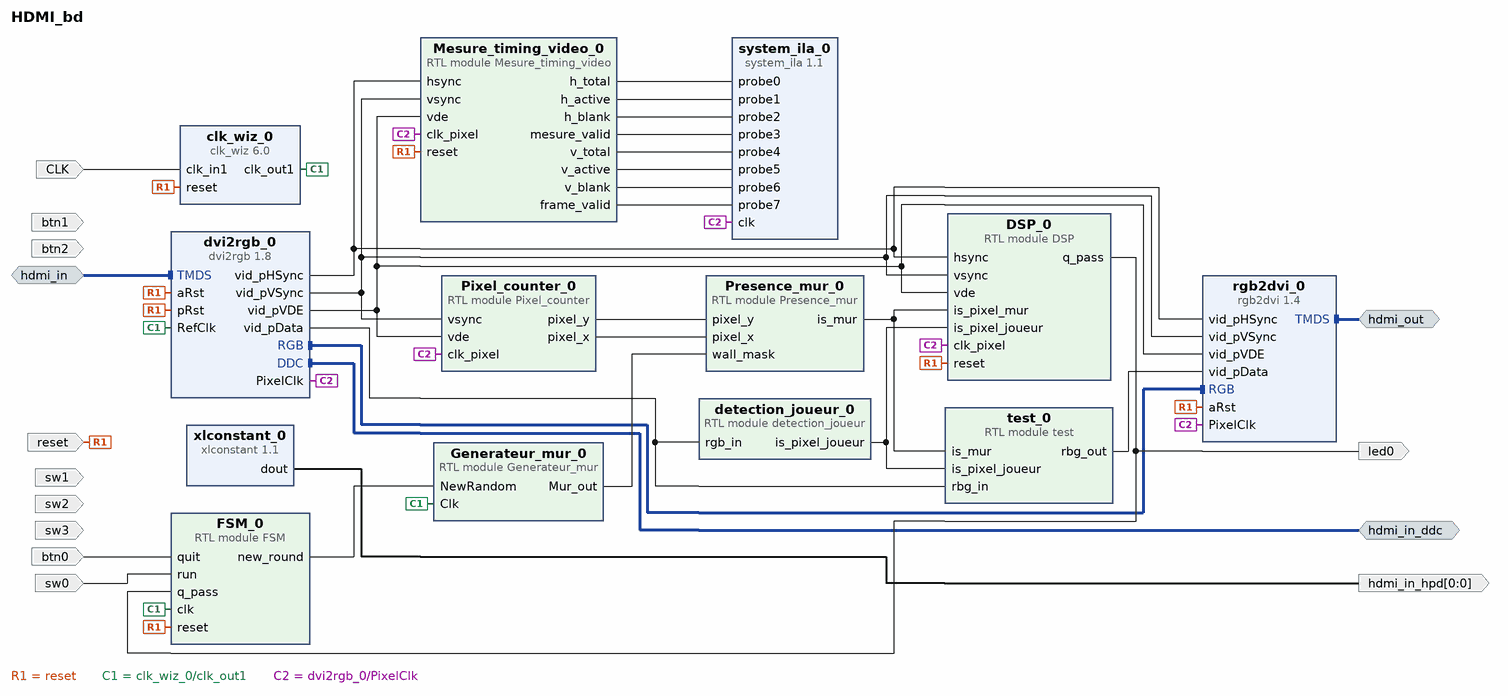
[diagram p0: block diagram of the top level]
# Vivado block design HDMI_bd, xc7z020clg400-1, Vivado 2018.2.1
create_bd_design HDMI_bd

create_bd_intf_port -mode Slave -vlnv digilentinc.com:interface:tmds_rtl:1.0 hdmi_in
create_bd_intf_port -mode Master -vlnv xilinx.com:interface:iic_rtl:1.0 hdmi_in_ddc
create_bd_intf_port -mode Master -vlnv digilentinc.com:interface:tmds_rtl:1.0 hdmi_out
create_bd_port -dir I sw2
create_bd_port -dir I sw3
create_bd_port -dir I btn1
create_bd_port -dir I btn2
create_bd_port -dir I -type clk CLK
set_property -dict {CONFIG.FREQ_HZ 125000000} [get_bd_ports CLK]
create_bd_port -dir I -type rst reset
set_property -dict {CONFIG.POLARITY ACTIVE_HIGH} [get_bd_ports reset]
create_bd_port -dir O -from 0 -to 0 hdmi_in_hpd
create_bd_port -dir I btn0
create_bd_port -dir I sw0
create_bd_port -dir I sw1
create_bd_port -dir O led0

create_bd_cell -type ip -vlnv xilinx.com:ip:xlconstant:1.1 xlconstant_0
create_bd_cell -type ip -vlnv xilinx.com:ip:clk_wiz:6.0 clk_wiz_0
set_property -dict [list \
  CONFIG.PRIMITIVE PLL \
  CONFIG.PRIM_IN_FREQ 125.000 \
  CONFIG.CLKIN1_JITTER_PS 80.0 \
  CONFIG.CLKOUT1_REQUESTED_OUT_FREQ 200.000 \
  CONFIG.CLKOUT1_DRIVES BUFG \
  CONFIG.CLKOUT2_DRIVES BUFG \
  CONFIG.CLKOUT3_DRIVES BUFG \
  CONFIG.CLKOUT4_DRIVES BUFG \
  CONFIG.CLKOUT5_DRIVES BUFG \
  CONFIG.CLKOUT6_DRIVES BUFG \
  CONFIG.CLKOUT7_DRIVES BUFG \
  CONFIG.MMCM_DIVCLK_DIVIDE 1 \
  CONFIG.MMCM_CLKFBOUT_MULT_F 8 \
  CONFIG.MMCM_CLKIN1_PERIOD 8.000 \
  CONFIG.MMCM_CLKIN2_PERIOD 10.0 \
  CONFIG.MMCM_COMPENSATION ZHOLD \
  CONFIG.MMCM_CLKOUT0_DIVIDE_F 5 \
  CONFIG.CLKOUT1_JITTER 109.241 \
  CONFIG.CLKOUT1_PHASE_ERROR 96.948 \
] [get_bd_cells clk_wiz_0]
create_bd_cell -type ip -vlnv digilentinc.com:ip:dvi2rgb:1.8 dvi2rgb_0
create_bd_cell -type ip -vlnv digilentinc.com:ip:rgb2dvi:1.4 rgb2dvi_0
set_property -dict [list \
  CONFIG.kClkPrimitive MMCM \
  CONFIG.kClkRange 3 \
  CONFIG.kD0Swap false \
  CONFIG.kD1Swap false \
  CONFIG.kD2Swap false \
] [get_bd_cells rgb2dvi_0]
create_bd_cell -type module -reference Generateur_mur Generateur_mur_0
create_bd_cell -type module -reference test test_0
create_bd_cell -type module -reference FSM FSM_0
create_bd_cell -type module -reference detection_joueur detection_joueur_0
create_bd_cell -type module -reference DSP DSP_0
create_bd_cell -type module -reference Pixel_counter Pixel_counter_0
create_bd_cell -type module -reference Presence_mur Presence_mur_0
create_bd_cell -type ip -vlnv xilinx.com:ip:system_ila:1.1 system_ila_0
set_property -dict [list \
  CONFIG.C_PROBE6_WIDTH 12 \
  CONFIG.C_PROBE5_WIDTH 12 \
  CONFIG.C_PROBE4_WIDTH 12 \
  CONFIG.C_PROBE2_WIDTH 12 \
  CONFIG.C_PROBE1_WIDTH 12 \
  CONFIG.C_PROBE0_WIDTH 12 \
  CONFIG.C_NUM_OF_PROBES 8 \
  CONFIG.C_MON_TYPE NATIVE \
  CONFIG.C_PROBE_WIDTH_PROPAGATION MANUAL \
] [get_bd_cells system_ila_0]
create_bd_cell -type module -reference Mesure_timing_video Mesure_timing_video_0

# ---- connections ----

connect_bd_intf_net [get_bd_intf_pins dvi2rgb_0/RGB] [get_bd_intf_pins rgb2dvi_0/RGB]
connect_bd_intf_net [get_bd_intf_ports hdmi_in] [get_bd_intf_pins dvi2rgb_0/TMDS]
connect_bd_intf_net [get_bd_intf_ports hdmi_in_ddc] [get_bd_intf_pins dvi2rgb_0/DDC]
connect_bd_intf_net [get_bd_intf_ports hdmi_out] [get_bd_intf_pins rgb2dvi_0/TMDS]
connect_bd_net [get_bd_ports CLK] [get_bd_pins clk_wiz_0/clk_in1]
connect_bd_net [get_bd_ports reset] \
  [get_bd_pins clk_wiz_0/reset] [get_bd_pins dvi2rgb_0/aRst] [get_bd_pins dvi2rgb_0/pRst] [get_bd_pins rgb2dvi_0/aRst] \
  [get_bd_pins FSM_0/reset] [get_bd_pins DSP_0/reset] [get_bd_pins Mesure_timing_video_0/reset]
connect_bd_net [get_bd_pins clk_wiz_0/clk_out1] [get_bd_pins dvi2rgb_0/RefClk] [get_bd_pins Generateur_mur_0/Clk] [get_bd_pins FSM_0/clk]
connect_bd_net [get_bd_pins xlconstant_0/dout] [get_bd_ports hdmi_in_hpd]
connect_bd_net [get_bd_pins dvi2rgb_0/vid_pHSync] \
  [get_bd_pins rgb2dvi_0/vid_pHSync] [get_bd_pins DSP_0/hsync] [get_bd_pins Mesure_timing_video_0/hsync]
connect_bd_net [get_bd_pins dvi2rgb_0/vid_pVSync] \
  [get_bd_pins rgb2dvi_0/vid_pVSync] [get_bd_pins DSP_0/vsync] [get_bd_pins Pixel_counter_0/vsync] \
  [get_bd_pins Mesure_timing_video_0/vsync]
connect_bd_net [get_bd_pins dvi2rgb_0/vid_pVDE] \
  [get_bd_pins rgb2dvi_0/vid_pVDE] [get_bd_pins DSP_0/vde] [get_bd_pins Pixel_counter_0/vde] \
  [get_bd_pins Mesure_timing_video_0/vde]
connect_bd_net [get_bd_pins test_0/rbg_out] [get_bd_pins rgb2dvi_0/vid_pData]
connect_bd_net [get_bd_pins detection_joueur_0/is_pixel_joueur] [get_bd_pins test_0/is_pixel_joueur] [get_bd_pins DSP_0/is_pixel_joueur]
connect_bd_net [get_bd_pins Presence_mur_0/is_mur] [get_bd_pins test_0/is_mur] [get_bd_pins DSP_0/is_pixel_mur]
connect_bd_net [get_bd_pins Generateur_mur_0/Mur_out] [get_bd_pins Presence_mur_0/wall_mask]
connect_bd_net [get_bd_pins FSM_0/new_round] [get_bd_pins Generateur_mur_0/NewRandom]
connect_bd_net -net btn0_1 [get_bd_ports btn0] [get_bd_pins FSM_0/quit]
connect_bd_net -net sw0_1 [get_bd_ports sw0] [get_bd_pins FSM_0/run]
connect_bd_net [get_bd_pins DSP_0/q_pass] [get_bd_pins FSM_0/q_pass] [get_bd_ports led0]
connect_bd_net [get_bd_pins Pixel_counter_0/pixel_y] [get_bd_pins Presence_mur_0/pixel_y]
connect_bd_net [get_bd_pins dvi2rgb_0/PixelClk] \
  [get_bd_pins system_ila_0/clk] [get_bd_pins rgb2dvi_0/PixelClk] [get_bd_pins DSP_0/clk_pixel] \
  [get_bd_pins Pixel_counter_0/clk_pixel] [get_bd_pins Mesure_timing_video_0/clk_pixel]
connect_bd_net [get_bd_pins Mesure_timing_video_0/h_total] [get_bd_pins system_ila_0/probe0]
connect_bd_net [get_bd_pins Mesure_timing_video_0/h_active] [get_bd_pins system_ila_0/probe1]
connect_bd_net [get_bd_pins Mesure_timing_video_0/h_blank] [get_bd_pins system_ila_0/probe2]
connect_bd_net [get_bd_pins Mesure_timing_video_0/mesure_valid] [get_bd_pins system_ila_0/probe3]
connect_bd_net [get_bd_pins Pixel_counter_0/pixel_x] [get_bd_pins Presence_mur_0/pixel_x]
connect_bd_net [get_bd_pins dvi2rgb_0/vid_pData] [get_bd_pins detection_joueur_0/rgb_in] [get_bd_pins test_0/rbg_in]
connect_bd_net [get_bd_pins Mesure_timing_video_0/v_total] [get_bd_pins system_ila_0/probe4]
connect_bd_net [get_bd_pins Mesure_timing_video_0/v_active] [get_bd_pins system_ila_0/probe5]
connect_bd_net [get_bd_pins Mesure_timing_video_0/v_blank] [get_bd_pins system_ila_0/probe6]
connect_bd_net [get_bd_pins Mesure_timing_video_0/frame_valid] [get_bd_pins system_ila_0/probe7]

validate_bd_design
save_bd_design
